# Altium schematic sheet Power.SchDoc
size A3
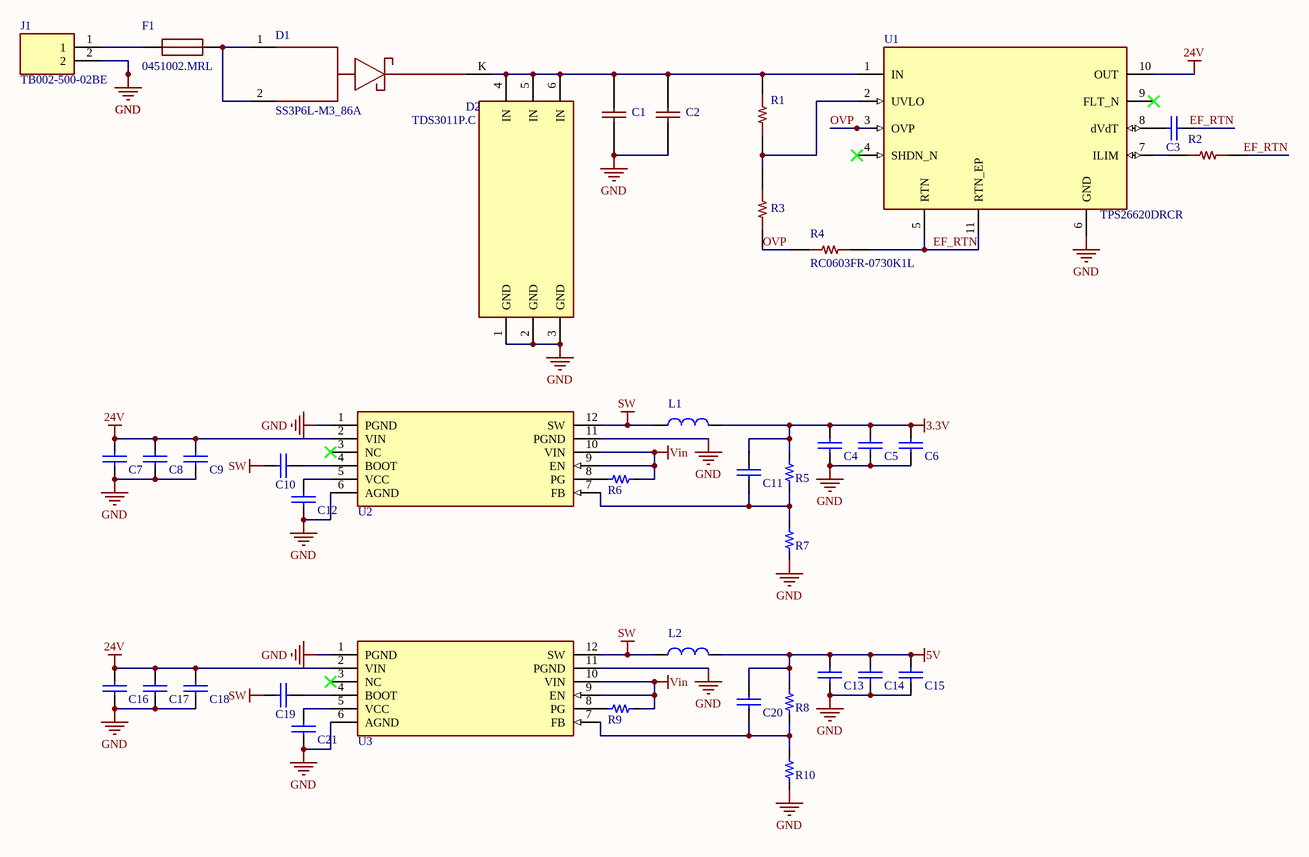
[diagram p0: Power.SchDoc]

## Parts
C1  C0805C224K1RACTU  [GW_0805_KEMET_NOMINAL]  (value not drawn)
C2  C5750X7R2A475K230KA  [GW_C5750_TDK_REFLOW]  (value not drawn)
C3  10 nF  [GW_CAND_0603_cap]  (value not drawn)
C4  15 uF por unidad; 45 uF nominal banco  (value not drawn)
C5  15 uF por unidad; 45 uF nominal banco  (value not drawn)
C6  15 uF por unidad; 45 uF nominal banco  (value not drawn)
C7  4.7 uF  [GW_CAND_0805_cap]  (value not drawn)
C8  220 nF  [GW_CAND_0805_cap]  (value not drawn)
C9  220 nF  [GW_CAND_0805_cap]  (value not drawn)
C10  100 nF  [GW_CAND_0603_cap]  (value not drawn)
C11  20 pF  [GW_CAND_0603_cap]  (value not drawn)
C12  1 uF  [GW_CAND_0603_cap]  (value not drawn)
C13  15 uF por unidad; 45 uF nominal banco  (value not drawn)
C14  15 uF por unidad; 45 uF nominal banco  (value not drawn)
C15  15 uF por unidad; 45 uF nominal banco  (value not drawn)
C16  4.7 uF  [GW_CAND_0805_cap]  (value not drawn)
C17  220 nF  [GW_CAND_0805_cap]  (value not drawn)
C18  220 nF  [GW_CAND_0805_cap]  (value not drawn)
C19  100 nF  [GW_CAND_0603_cap]  (value not drawn)
C20  20 pF  [GW_CAND_0603_cap]  (value not drawn)
C21  1 uF  [GW_CAND_0603_cap]  (value not drawn)
D1  SS3P6L-M3_86A  [GW_SS3P6L_VISHAY_88987]
D2  TDS3011P.C  [GW_TDS3011P_SEMTECH]
F1  0451002.MRL
J1  TB002-500-02BE  [CUI_TB002-500-02BE]
L1  6.8 uH  (value not drawn)
L2  10 uH  (value not drawn)
R1  RC0603FR-07768KL  [GW_RC0603_YAGEO_REFLOW]  (value not drawn)
R2  RC0603FR-0713K3L  [GW_RC0603_YAGEO_REFLOW]  (value not drawn)
R3  RC0603FR-0733K2L  [GW_RC0603_YAGEO_REFLOW]  (value not drawn)
R4  RC0603FR-0730K1L  [GW_RC0603_YAGEO_REFLOW]
R5  43.2 kOhm  [GW_CAND_0603_res]  (value not drawn)
R6  100 kOhm  [GW_CAND_0603_res]  (value not drawn)
R7  43.2 kOhm  [GW_CAND_0603_res]  (value not drawn)
R8  43.2 kOhm  [GW_CAND_0603_res]  (value not drawn)
R9  100 kOhm  [GW_CAND_0603_res]  (value not drawn)
R10  24.9 kOhm  [GW_CAND_0603_res]  (value not drawn)
U1  TPS26620DRCR  [GW_DRC0010J_TI_TPS2662]
U2  LMR36015FBRNXR  [GW_RNX0012A_TI]  (value not drawn)
U3  LMR36015FBRNXR  [GW_RNX0012A_TI]  (value not drawn)

## Nets
3.3V: C4.1 C5.1 C6.1 C11.1 L1.2 R5.2
5V: C13.1 C14.1 C15.1 C20.1 L2.2 R8.2
24V: C7.1 C8.1 C9.1 C16.1 C17.1 C18.1 U1.10(OUT) U2.2(VIN) U3.2(VIN)
GND: C1.1 C2.1 C4.2 C5.2 C6.2 C7.2 C8.2 C9.2 C12.2 C13.2 C14.2 C15.2 C16.2 C17.2 C18.2 C21.2 D2.1(GND) D2.2(GND) D2.3(GND) J1.2 R7.1 R10.1 U1.6(GND) U2.1(PGND) U2.6(AGND) U2.11(PGND) U3.1(PGND) U3.6(AGND) U3.11(PGND)
SW: C10.1 C19.1 L1.1 L2.1 U2.12(SW) U3.12(SW)
Vin: R6.1 R9.1 U2.9(EN) U2.10(VIN) U3.9(EN) U3.10(VIN)
EF_RTN: C3.1 R2.2 R4.2 U1.5(RTN) U1.11(RTN_EP)
OVP: R3.1 R4.1 U1.3(OVP)
NetC1_2: C1.2 C2.2 D1.K(CATHODE) D2.4(IN) D2.5(IN) D2.6(IN) R1.2 U1.1(IN)
NetC3_2: C3.2 U1.8(dVdT)
NetC10_2: C10.2 U2.4(BOOT)
NetC11_2: C11.2 R5.1 R7.2 U2.7(FB)
NetC12_1: C12.1 U2.5(VCC)
NetC19_2: C19.2 U3.4(BOOT)
NetC20_2: C20.2 R8.1 R10.2 U3.7(FB)
NetC21_1: C21.1 U3.5(VCC)
NetD1_1: D1.1(ANODE1) D1.2(ANODE2) F1.2(END2)
NetF1_1: F1.1(END1) J1.1
NetR1_1: R1.1 R3.2 U1.2(UVLO)
NetR2_1: R2.1 U1.7(ILIM)
NetR6_2: R6.2 U2.8(PG)
NetR9_2: R9.2 U3.8(PG)

Not connected (* = marked no-connect by the designer): U1 4(SHDN_N)* 9(FLT_N)*; U2 3(NC)*; U3 3(NC)*

## Library data of the parts
C1 = C0805C224K1RACTU: KEMET exact0805 spec body/termination dimensions; KEMET C1027 p12 Table3 nominal2012 reflow lands transferred to mechanically matching commercial0805; 220nF10%100VX7R;; Design Approval: PROTOTYPE_APPROVED; Electrical Test: NOT_TESTED; CAD Status: CAD_VERIFIED; Limitations: None; Manufacturer: KEMET; Manufacturer Part Number: C0805C224K1RACTU; Value: 220nF10%100VX7R; Source: KEMET exact0805 spec body/termination dimensions; KEMET C1027 p12 Table3 nominal2012 reflow lands transferred to mechanically matching commercial0805
C2 = C5750X7R2A475K230KA: TDK C5750X7R2A475K230KA exact2014web-derived PDF p1 lands,p2 DCbias; current official product page same PA/PB/PC; 4.7uF10%100VX7R;; Design Approval: PROTOTYPE_APPROVED; Electrical Test: NOT_TESTED; CAD Status: CAD_VERIFIED; Limitations: None; Manufacturer: TDK; Manufacturer Part Number: C5750X7R2A475K230KA; Value: 4.7uF10%100VX7R; Source: TDK C5750X7R2A475K230KA exact2014web-derived PDF p1 lands,p2 DCbias; current official product page same PA/PB/PC
C3 = GW_C0603C103K1RACTU_97f3ee33: C0603C103K1RACTU; 10 nF; 100 V; X7R; -55..125 C; CAD_CANDIDATE; Manufacturer: KEMET; Tolerance: 10%; Electrical_Status: PROVISIONAL; CAD_Source: Professor_shared.SchLib glyph Cap_0.1uF_0603_50V; CAD_Limitations: Glyph pins/types inspected; exact manufacturer land-pattern/mask/paste qualification pending.; Electrical_Notes: Ficha KEMET local DI_CIN p1; no confundir con externo CL10B103KA8WPNC 25 V. Modelo candidato existente; sin cotejo visual de pads/pines en Altium.; Manufacturer Part Number: C0603C103K1RACTU; Value: 10 nF; Rating: 100 V; X7R; -55..125 C; Power Rating: N/A; Package: 0603; CAD_Status: CAD_CANDIDATE
C4-C6 C13-C15 = GW_C3225X7R1C156M250AB_bb412b42: C3225X7R1C156M250AB; 15 uF por unidad; 45 uF nominal banco; 16 V; X7R; CAD_CANDIDATE; Manufacturer: TDK; Tolerance: 20%; CAD_Status: CAD_BLOCKED; Electrical_Status: PROVISIONAL; CAD_Source: Professor_shared.SchLib glyph Cap_0.1uF_0603_50V; CAD_Limitations: Symbol only. Exact manufacturer land pattern absent locally; footprint blocked. Ratings copied from provisional BOM, not newly approved.; Electrical_Notes: Ceff a 3.3 V, ESR, escalon de carga y Bode pendientes. No atribuir 45 uF efectivos ni ESR3.04mOhm del modelo AR. Sin footprint1210 docente.; Manufacturer Part Number: C3225X7R1C156M250AB; Value: 15 uF por unidad; 45 uF nominal banco; Rating: 16 V; X7R; Power Rating: N/A; Package: 1210
C7 C16 = GW_C0805C475K4RACTU_82374e08: C0805C475K4RACTU; 4.7 uF; 16 V; X7R; CAD_CANDIDATE; Manufacturer: KEMET; Tolerance: 10%; Electrical_Status: PROVISIONAL; CAD_Source: Professor_shared.SchLib glyph Cap_10uF_0805_25V_; CAD_Limitations: Glyph pins/types inspected; exact manufacturer land-pattern/mask/paste qualification pending.; Electrical_Notes: Ceff a 3.3 V pendiente; no sustituir por 10 uF solo por disponibilidad. Modelo candidato existente; sin cotejo visual de pads/pines en Altium.; Manufacturer Part Number: C0805C475K4RACTU; Value: 4.7 uF; Rating: 16 V; X7R; Power Rating: N/A; Package: 0805; CAD_Status: CAD_CANDIDATE
C8 C9 C17 C18 = GW_C0805C224K1RACTU_e16e52b8: C0805C224K1RACTU; 220 nF; 100 V; X7R; CAD_CANDIDATE; Manufacturer: KEMET; Tolerance: 10%; Electrical_Status: PROVISIONAL; CAD_Source: Professor_shared.SchLib glyph Cap_10uF_0805_25V_; CAD_Limitations: Glyph pins/types inspected; exact manufacturer land-pattern/mask/paste qualification pending.; Electrical_Notes: Uno por par VIN-PGND en lados opuestos; falta Ceff y cotejo dimensiones pads. Modelo candidato existente; sin cotejo visual de pads/pines en Altium.; Manufacturer Part Number: C0805C224K1RACTU; Value: 220 nF; Rating: 100 V; X7R; Power Rating: N/A; Package: 0805; CAD_Status: CAD_CANDIDATE
C10 C19 = GW_C0603C104K5RACTU_dc5e12a5: C0603C104K5RACTU; 100 nF; 50 V; X7R; -55..125 C; CAD_CANDIDATE; Manufacturer: KEMET; Tolerance: 10%; Electrical_Status: PROVISIONAL; CAD_Source: Professor_shared.SchLib glyph Cap_0.1uF_0603_50V; CAD_Limitations: Glyph pins/types inspected; exact manufacturer land-pattern/mask/paste qualification pending.; Electrical_Notes: Ficha KEMET local p1. Adaptar parametros; no usar el Y5V 0603F104Z500CT como equivalente. Modelo candidato existente; sin cotejo visual de pads/pines en Altium.; Manufacturer Part Number: C0603C104K5RACTU; Value: 100 nF; Rating: 50 V; X7R; -55..125 C; Power Rating: N/A; Package: 0603; CAD_Status: CAD_CANDIDATE
C11 C20 = GW_C0603C200J5GACTU_c75b007a: C0603C200J5GACTU; 20 pF; 50 V; C0G; CAD_CANDIDATE; Manufacturer: KEMET; Tolerance: 5%; Electrical_Status: PROVISIONAL; CAD_Source: Professor_shared.SchLib glyph Cap_0.1uF_0603_50V; CAD_Limitations: Glyph pins/types inspected; exact manufacturer land-pattern/mask/paste qualification pending.; Electrical_Notes: Valor guia fabricante; validar lazo. Con RFBT100k no obligatorio universal; reservar DNP hasta respuesta/Bode. Modelo candidato existente; sin cotejo visual de pads/pines en Altium.; Manufacturer Part Number: C0603C200J5GACTU; Value: 20 pF; Rating: 50 V; C0G; Power Rating: N/A; Package: 0603; CAD_Status: CAD_CANDIDATE
C12 C21 = GW_CL10A105KB8NNNC_c3932faa: CL10A105KB8NNNC; 1 uF; 50 V; X5R; -55..85 C; CAD_CANDIDATE; Manufacturer: Samsung Electro-Mechanics; Tolerance: 10%; Electrical_Status: PROVISIONAL; CAD_Source: Professor_shared.SchLib glyph Cap_1uF_0603_50V; CAD_Limitations: Glyph pins/types inspected; exact manufacturer land-pattern/mask/paste qualification pending.; Electrical_Notes: Samsung ficha oficial; Ceff/ESR pendientes por aplicacion. Limite X5R 85 C: no homologado para ambiente superior. Modelo candidato existente; sin cotejo visual de pads/pines en Altium.; Manufacturer Part Number: CL10A105KB8NNNC; Value: 1 uF; Rating: 50 V; X5R; -55..85 C; Power Rating: N/A; Package: 0603; CAD_Status: CAD_CANDIDATE
D1 = SS3P6L-M3_86A: User-approved series reverse diode:manufacturer1/2 anodes,K large cathode. Same model also reserved DNP output clamp; do not populateSOUT withoutVF review. No hot reverse while charged.; Manufacturer: Vishay; Manufacturer Part Number: SS3P6L-M3/86A; CAD Status: CAD_VERIFIED; Electrical Approval: PROTOTYPE_APPROVED; Electrical Test: NOT_TESTED; Source: Vishay88987 Rev24-Apr-2020 pp1,4; numbered anodes1/2, cathodeK; minimum mounting lands; Datasheet: sources/SS3P6L_88987.pdf; Limitations: User-approved series reverse diode:manufacturer1/2 anodes,K large cathode. Same model also reserved DNP output clamp; do not populateSOUT withoutVF review. No hot reverse while charged.; Design Approval: PROTOTYPE_APPROVED
D2 = TDS3011P.C: Semtech TDS3011P Rev2.0 16-Jun-2021 pp5-7; p6 reference land pattern; All six pins must connect. 30V working limit; source tolerance, hot leakage and transient coordination not approved. Manufacturer reference copper; mask/paste DFM pending.; CAD Status: CAD_CANDIDATE; Electrical Approval: PROPOSED_FOR_REUSE; Manufacturer: Semtech; Manufacturer Part Number: TDS3011P.C; Source: Semtech TDS3011P Rev2.0 16-Jun-2021 pp5-7; p6 reference land pattern; Datasheet: sources/input_protection/TDS3011P.pdf; Limitations: All six pins must connect. 30V working limit; source tolerance, hot leakage and transient coordination not approved. Manufacturer reference copper; mask/paste DFM pending.
F1 = 0451002.MRL: User-approved2A125VDC fuse; manufacturer dimensioned native footprint linked. Nonpolar terminals project1/2; supervised current-limited lab source. Not electrically tested.; Manufacturer: Littelfuse; CAD Status: CAD_VERIFIED; Electrical Approval: PROTOTYPE_APPROVED; Electrical Test: NOT_TESTED; Manufacturer Part Number: 0451002.MRL; Source: Official451/453 series Rev01-Dec-2025 pp1-4; electrical row002 and ordering; Datasheet: https://www.littelfuse.com/assetdocs/fuse-451-and-453-datasheet?assetguid=533cd5cc-956c-4243-867f-6ab5a62f6ba1; Limitations: User-approved2A125VDC fuse; manufacturer dimensioned native footprint linked. Nonpolar terminals project1/2; supervised current-limited lab source. Not electrically tested.; Design Approval: PROTOTYPE_APPROVED
J1 = TB002-500-02BE: 2~24 Poles, Screw Type, Horizontal, 5.0 Pitch, 22~12 (AWG), Terminal Block Connector; Manufacturer: Same Sky (Formerly CUI Devices); MF: Same Sky; SnapEDA_Link: https://www.snapeda.com/parts/TB002-500-02BE/Same+Sky/view-part/?ref=snap; Package: None; Value: *; MP: TB002-500-02BE; Check_prices: https://www.snapeda.com/parts/TB002-500-02BE/Same+Sky/view-part/?ref=eda; Manufacturer Part Number: TB002-500-02BE
L1 = GW_XAL4030-682MEC_71dfd711: XAL4030-682MEC; 6.8 uH; Isat25C 3.6 A; Irms20C 3.0 A; CAD_CANDIDATE; Manufacturer: Coilcraft; Tolerance: 20%; CAD_Status: CAD_BLOCKED; Electrical_Status: PROVISIONAL; CAD_Source: Professor_shared.SchLib glyph Inductor_10uH_4A_7.2*6.6mm; CAD_Limitations: Symbol only. Exact manufacturer land pattern absent locally; footprint blocked. Ratings copied from provisional BOM, not newly approved.; Electrical_Notes: DCRmax25C 74.1 mOhm. Isat es caida30% tipica; falta derating caliente/curva L(I)/perdidas nucleo y CAD. No usar inductor docente sin Isat verificable.; Manufacturer Part Number: XAL4030-682MEC; Value: 6.8 uH; Rating: Isat25C 3.6 A; Irms20C 3.0 A; Power Rating: N/A; Package: XAL4030
L2 = GW_XAL4040-103MEC_b36cb917: XAL4040-103MEC; 10 uH; Isat25C 3.0 A; Irms20C 2.2 A; CAD_CANDIDATE; Manufacturer: Coilcraft; Tolerance: 20%; CAD_Status: CAD_BLOCKED; Electrical_Status: PROVISIONAL; CAD_Source: Professor_shared.SchLib glyph Inductor_10uH_4A_7.2*6.6mm; CAD_Limitations: Symbol only. Exact manufacturer land pattern absent locally; footprint blocked. Ratings copied from provisional BOM, not newly approved.; Electrical_Notes: DCRmax25C 92.4 mOhm. Isat es caida30% tipica; falta derating caliente/curva L(I)/perdidas nucleo y CAD. No usar inductor docente sin Isat verificable.; Manufacturer Part Number: XAL4040-103MEC; Value: 10 uH; Rating: Isat25C 3.0 A; Irms20C 2.2 A; Power Rating: N/A; Package: XAL4040
R1 = RC0603FR-07768KL: 768kOhm1%0.1W75V; Exact Yageo spec; manufacturer Mounting2018p4Fig4/Table1; Design Approval: PROPOSED_APPLICATION_VALUE; CAD Status: CAD_VERIFIED; Electrical Test: NOT_TESTED; Manufacturer: Yageo; Manufacturer Part Number: RC0603FR-07768KL; Value: 768kOhm1%0.1W75V; Source: Exact Yageo spec; manufacturer Mounting2018p4Fig4/Table1; Datasheet: https://yageogroup.com/download/specsheet/RC0603FR-07768KL
R2 = RC0603FR-0713K3L: 13.3kOhm1%0.1W75V; Exact Yageo spec; manufacturer Mounting2018p4Fig4/Table1; Design Approval: PROPOSED_APPLICATION_VALUE; CAD Status: CAD_VERIFIED; Electrical Test: NOT_TESTED; Manufacturer: Yageo; Manufacturer Part Number: RC0603FR-0713K3L; Value: 13.3kOhm1%0.1W75V; Source: Exact Yageo spec; manufacturer Mounting2018p4Fig4/Table1; Datasheet: https://yageogroup.com/download/specsheet/RC0603FR-0713K3L
R3 = RC0603FR-0733K2L: 33.2kOhm1%0.1W75V; Exact Yageo spec; manufacturer Mounting2018p4Fig4/Table1; Design Approval: PROPOSED_APPLICATION_VALUE; CAD Status: CAD_VERIFIED; Electrical Test: NOT_TESTED; Manufacturer: Yageo; Manufacturer Part Number: RC0603FR-0733K2L; Value: 33.2kOhm1%0.1W75V; Source: Exact Yageo spec; manufacturer Mounting2018p4Fig4/Table1; Datasheet: https://yageogroup.com/download/specsheet/RC0603FR-0733K2L
R4 = RC0603FR-0730K1L: 30.1kOhm1%0.1W75V; Exact Yageo spec; manufacturer Mounting2018p4Fig4/Table1; Design Approval: PROPOSED_APPLICATION_VALUE; CAD Status: CAD_VERIFIED; Electrical Test: NOT_TESTED; Manufacturer: Yageo; Manufacturer Part Number: RC0603FR-0730K1L; Value: 30.1kOhm1%0.1W75V; Source: Exact Yageo spec; manufacturer Mounting2018p4Fig4/Table1; Datasheet: https://yageogroup.com/download/specsheet/RC0603FR-0730K1L
R5 R7 R8 = GW_RC0603FR-0743K2L_a8308c0c: RC0603FR-0743K2L; 43.2 kOhm; 75 V max; limite sqrt(P*R); CAD_CANDIDATE; Manufacturer: Yageo; Tolerance: 1%; Power Rating: 0.1 W @70 C; Electrical_Status: PROVISIONAL; CAD_Source: Professor_shared.SchLib glyph Res_10k_0603_1/10W; CAD_Limitations: Glyph pins/types inspected; exact manufacturer land-pattern/mask/paste qualification pending.; Electrical_Notes: Vout nominal calculado 3.31481 V; ver esquinas de tolerancia. Cambiar parametros en copia docente. Modelo candidato existente; sin cotejo visual de pads/pines en Altium.; Manufacturer Part Number: RC0603FR-0743K2L; Value: 43.2 kOhm; Rating: 75 V max; limite sqrt(P*R); Package: 0603; CAD_Status: CAD_CANDIDATE
R6 R9 = GW_RC0603FR-07100KL_ac663db8: RC0603FR-07100KL; 100 kOhm; 75 V max; limite sqrt(P*R); CAD_CANDIDATE; Manufacturer: Yageo; Tolerance: 1%; Power Rating: 0.1 W @70 C; Electrical_Status: PROVISIONAL; CAD_Source: Professor_shared.SchLib glyph Res_10k_0603_1/10W; CAD_Limitations: Glyph pins/types inspected; exact manufacturer land-pattern/mask/paste qualification pending.; Electrical_Notes: Vout nominal calculado 3.31481 V; ver esquinas de tolerancia. Cambiar parametros en copia docente. Modelo candidato existente; sin cotejo visual de pads/pines en Altium.; Manufacturer Part Number: RC0603FR-07100KL; Value: 100 kOhm; Rating: 75 V max; limite sqrt(P*R); Package: 0603; CAD_Status: CAD_CANDIDATE
R10 = GW_RC0603FR-0724K9L_10698e9e: RC0603FR-0724K9L; 24.9 kOhm; 75 V max; limite sqrt(P*R); CAD_CANDIDATE; Manufacturer: Yageo; Tolerance: 1%; Power Rating: 0.1 W @70 C; Electrical_Status: PROVISIONAL; CAD_Source: Professor_shared.SchLib glyph Res_10k_0603_1/10W; CAD_Limitations: Glyph pins/types inspected; exact manufacturer land-pattern/mask/paste qualification pending.; Electrical_Notes: Vout nominal calculado 5.01606 V; ver esquinas de tolerancia. Cambiar parametros en copia docente. Modelo candidato existente; sin cotejo visual de pads/pines en Altium.; Manufacturer Part Number: RC0603FR-0724K9L; Value: 24.9 kOhm; Rating: 75 V max; limite sqrt(P*R); Package: 0603; CAD_Status: CAD_CANDIDATE
U1 = TPS26620DRCR: Single-channel60V eFuse; TPS26620 latch-off; RTN != system GND; DRC10+EP11; Manufacturer: Texas Instruments; Local Datasheet: sources/tps26620/tps2662.pdf; CAD Status: CAD_CANDIDATE; Design Approval: APPROVED_COMPONENT_SELECTION; Electrical Test: NOT_TESTED; Critical Connection: Pin5 and EP11 to EF_RTN, NEVER directly to system GND pin6; Fault Response: TPS26620 latch-off, adjustable overvoltage cutoff; not TPS26621 auto-retry; Manufacturer Part Number: TPS26620DRCR; Datasheet: https://www.ti.com/lit/ds/symlink/tps2662.pdf; Source: TI TPS2662 SLVSDT4F Dec2021 Table6-1 p4; DRC0010J4218878/B board p44/stencil p45; Footprint Limitation: Native custom-pad11 extension conversion/net inheritance pending; not PCB-release ready
U2 U3 = LMR36015FBRNXR: LMR36015FBRNXR; CAD_CANDIDATE; CAD_CANDIDATE: confirm delivered RNX revision A/B. NC3 is externally connected to SW per TI. RNX12 is SW, not a ground exposed pad. Two footprint variants retained.; Manufacturer: Texas Instruments; Electrical_Status: PROVISIONAL; CAD_Source: SNVSB49D p4; RNX0012A 4222858/A PDF pp44-46 and RNX0012B 4223969/C pp47-49; Manufacturer Part Number: LMR36015FBRNXR; Value: LMR36015FBRNXR; CAD_Status: CAD_CANDIDATE; CAD_Limitations: CAD_CANDIDATE: confirm delivered RNX revision A/B. NC3 is externally connected to SW per TI. RNX12 is SW, not a ground exposed pad. Two footprint variants retained.